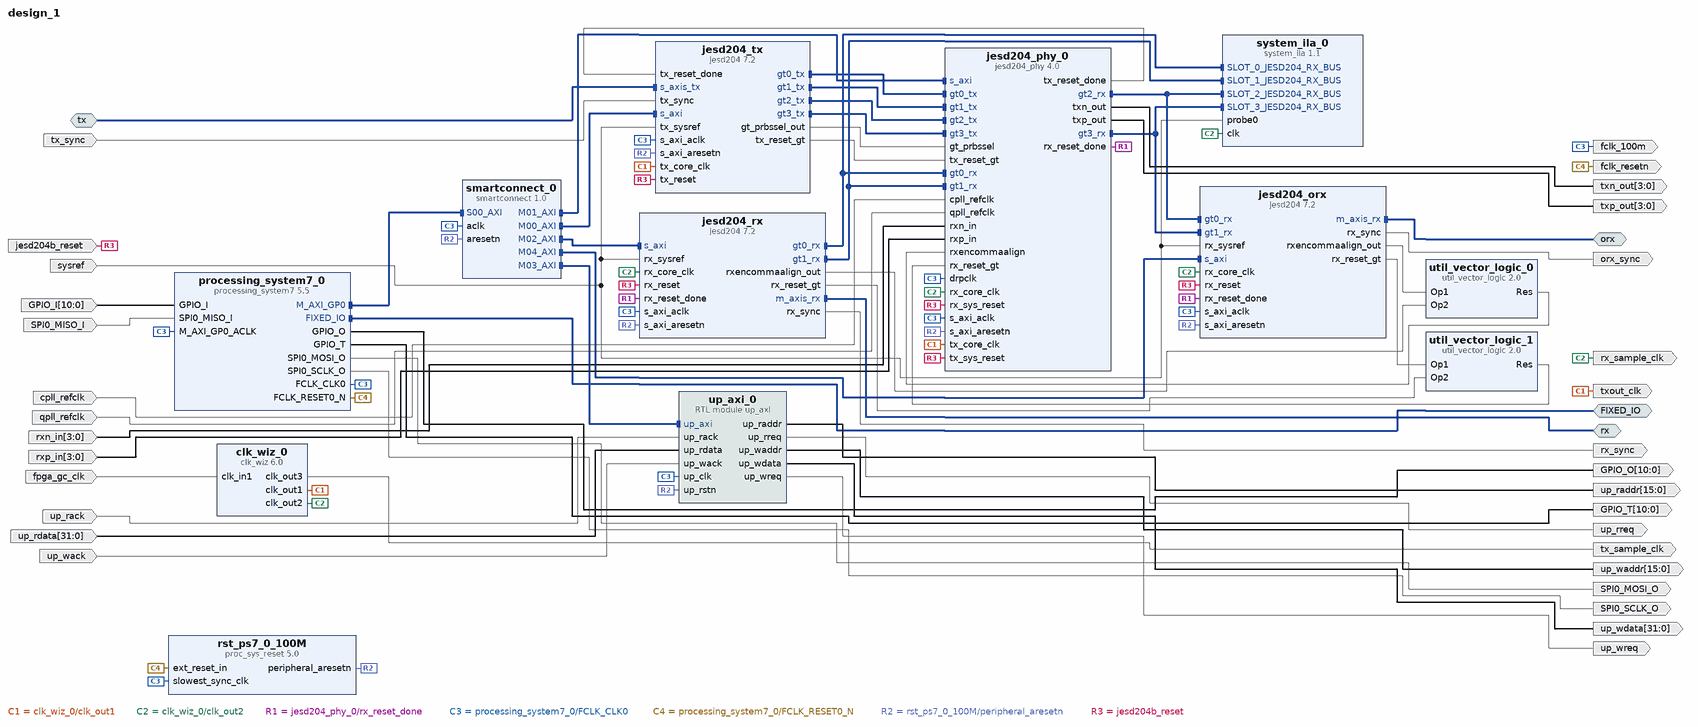
[diagram p0: block diagram of the top level]
# Vivado block design design_1, xc7z100ffg900-2, Vivado 2021.1
create_bd_design design_1

create_bd_intf_port -mode Slave -vlnv xilinx.com:interface:axis_rtl:1.0 tx
set_property -dict [list \
  CONFIG.FREQ_HZ 153600000 \
  CONFIG.HAS_TKEEP 0 \
  CONFIG.HAS_TLAST 0 \
  CONFIG.HAS_TREADY 1 \
  CONFIG.HAS_TSTRB 0 \
  CONFIG.LAYERED_METADATA undef \
  CONFIG.TDATA_NUM_BYTES 16 \
  CONFIG.TDEST_WIDTH 0 \
  CONFIG.TID_WIDTH 0 \
  CONFIG.TUSER_WIDTH 0 \
] [get_bd_intf_ports tx]
create_bd_intf_port -mode Master -vlnv xilinx.com:interface:axis_rtl:1.0 rx
set_property -dict {CONFIG.FREQ_HZ 153600000} [get_bd_intf_ports rx]
create_bd_intf_port -mode Master -vlnv xilinx.com:display_processing_system7:fixedio_rtl:1.0 FIXED_IO
create_bd_intf_port -mode Master -vlnv xilinx.com:interface:axis_rtl:1.0 orx
set_property -dict {CONFIG.FREQ_HZ 153600000} [get_bd_intf_ports orx]
create_bd_port -dir I jesd204b_reset
create_bd_port -dir O -from 3 -to 0 txp_out
create_bd_port -dir O -from 3 -to 0 txn_out
create_bd_port -dir I sysref
create_bd_port -dir I -from 3 -to 0 rxp_in
create_bd_port -dir I -from 3 -to 0 rxn_in
create_bd_port -dir I -type clk cpll_refclk
create_bd_port -dir I -type clk qpll_refclk
create_bd_port -dir I -type clk fpga_gc_clk
set_property -dict {CONFIG.FREQ_HZ 122880000} [get_bd_ports fpga_gc_clk]
create_bd_port -dir O -type clk tx_sample_clk
set_property -dict {CONFIG.FREQ_HZ 307200000} [get_bd_ports tx_sample_clk]
create_bd_port -dir O -type rst fclk_resetn
create_bd_port -dir O -from 10 -to 0 GPIO_O
create_bd_port -dir I -from 10 -to 0 GPIO_I
create_bd_port -dir O -from 10 -to 0 GPIO_T
create_bd_port -dir O -type clk txout_clk
set_property -dict {CONFIG.ASSOCIATED_BUSIF tx CONFIG.FREQ_HZ 153600000} [get_bd_ports txout_clk]
create_bd_port -dir O -type clk rx_sample_clk
set_property -dict {CONFIG.ASSOCIATED_BUSIF rx:orx CONFIG.FREQ_HZ 153600000} [get_bd_ports rx_sample_clk]
create_bd_port -dir I up_rack
create_bd_port -dir I -from 31 -to 0 up_rdata
create_bd_port -dir I up_wack
create_bd_port -dir O -from 15 -to 0 up_waddr
create_bd_port -dir O -from 31 -to 0 up_wdata
create_bd_port -dir O -from 15 -to 0 up_raddr
create_bd_port -dir O up_rreq
create_bd_port -dir O up_wreq
create_bd_port -dir O SPI0_SCLK_O
create_bd_port -dir O SPI0_MOSI_O
create_bd_port -dir I SPI0_MISO_I
create_bd_port -dir O -type clk fclk_100m
create_bd_port -dir I tx_sync
create_bd_port -dir O orx_sync
create_bd_port -dir O rx_sync

create_bd_cell -type ip -vlnv xilinx.com:ip:clk_wiz:6.0 clk_wiz_0
set_property -dict [list \
  CONFIG.CLKIN1_JITTER_PS 81.38 \
  CONFIG.CLKOUT1_JITTER 116.791 \
  CONFIG.CLKOUT1_PHASE_ERROR 100.322 \
  CONFIG.CLKOUT1_REQUESTED_OUT_FREQ 153.6 \
  CONFIG.CLKOUT2_JITTER 116.791 \
  CONFIG.CLKOUT2_PHASE_ERROR 100.322 \
  CONFIG.CLKOUT2_REQUESTED_OUT_FREQ 153.6 \
  CONFIG.CLKOUT2_USED true \
  CONFIG.CLKOUT3_JITTER 102.480 \
  CONFIG.CLKOUT3_PHASE_ERROR 100.322 \
  CONFIG.CLKOUT3_REQUESTED_OUT_FREQ 307.2 \
  CONFIG.CLKOUT3_USED true \
  CONFIG.CLKOUT4_JITTER 116.791 \
  CONFIG.CLKOUT4_PHASE_ERROR 100.322 \
  CONFIG.CLKOUT4_REQUESTED_OUT_FREQ 100.000 \
  CONFIG.CLKOUT4_USED false \
  CONFIG.MMCM_CLKFBOUT_MULT_F 7.500 \
  CONFIG.MMCM_CLKIN1_PERIOD 8.138 \
  CONFIG.MMCM_CLKIN2_PERIOD 10.000 \
  CONFIG.MMCM_CLKOUT0_DIVIDE_F 6.000 \
  CONFIG.MMCM_CLKOUT1_DIVIDE 6 \
  CONFIG.MMCM_CLKOUT2_DIVIDE 3 \
  CONFIG.MMCM_CLKOUT3_DIVIDE 1 \
  CONFIG.MMCM_DIVCLK_DIVIDE 1 \
  CONFIG.NUM_OUT_CLKS 3 \
  CONFIG.PRIM_IN_FREQ 122.88 \
  CONFIG.USE_LOCKED false \
  CONFIG.USE_RESET false \
] [get_bd_cells clk_wiz_0]
create_bd_cell -type ip -vlnv xilinx.com:ip:jesd204:7.2 jesd204_tx
set_property -dict {CONFIG.C_DEFAULT_SCR 1 CONFIG.C_LANES 4 CONFIG.C_SYSREF_SAMPLING_EDGE 0} [get_bd_cells jesd204_tx]
create_bd_cell -type ip -vlnv xilinx.com:ip:jesd204:7.2 jesd204_orx
set_property -dict {CONFIG.C_DEFAULT_SCR 1 CONFIG.C_NODE_IS_TRANSMIT 0} [get_bd_cells jesd204_orx]
create_bd_cell -type ip -vlnv xilinx.com:ip:jesd204:7.2 jesd204_rx
set_property -dict [list \
  CONFIG.C_DEFAULT_F 4 \
  CONFIG.C_DEFAULT_SCR 1 \
  CONFIG.C_LANES 2 \
  CONFIG.C_NODE_IS_TRANSMIT 0 \
] [get_bd_cells jesd204_rx]
create_bd_cell -type ip -vlnv xilinx.com:ip:jesd204_phy:4.0 jesd204_phy_0
set_property -dict [list \
  CONFIG.C_LANES 4 \
  CONFIG.C_PLL_SELECTION 3 \
  CONFIG.Config_Type 1 \
  CONFIG.GT_Line_Rate 6.144 \
  CONFIG.GT_REFCLK_FREQ 122.880 \
  CONFIG.Max_Line_Rate 6.144 \
  CONFIG.Min_Line_Rate 6.144 \
  CONFIG.RX_GT_Line_Rate 6.144 \
  CONFIG.RX_GT_REFCLK_FREQ 122.880 \
  CONFIG.RX_PLL_SELECTION 0 \
  CONFIG.SupportLevel 1 \
] [get_bd_cells jesd204_phy_0]
create_bd_cell -type ip -vlnv xilinx.com:ip:processing_system7:5.5 processing_system7_0
set_property -dict [list \
  CONFIG.PCW_APU_PERIPHERAL_FREQMHZ 666.666666 \
  CONFIG.PCW_CPU_CPU_6X4X_MAX_RANGE 800 \
  CONFIG.PCW_DUAL_PARALLEL_QSPI_DATA_MODE x8 \
  CONFIG.PCW_ENET0_ENET0_IO {MIO 16 .. 27} \
  CONFIG.PCW_ENET0_GRP_MDIO_ENABLE 1 \
  CONFIG.PCW_ENET0_GRP_MDIO_IO {MIO 52 .. 53} \
  CONFIG.PCW_ENET0_PERIPHERAL_ENABLE 1 \
  CONFIG.PCW_ENET0_RESET_ENABLE 0 \
  CONFIG.PCW_ENET_RESET_ENABLE 1 \
  CONFIG.PCW_ENET_RESET_SELECT {Share reset pin} \
  CONFIG.PCW_FPGA0_PERIPHERAL_FREQMHZ 100 \
  CONFIG.PCW_FPGA1_PERIPHERAL_FREQMHZ 50 \
  CONFIG.PCW_GPIO_EMIO_GPIO_ENABLE 1 \
  CONFIG.PCW_GPIO_EMIO_GPIO_IO 11 \
  CONFIG.PCW_GPIO_EMIO_GPIO_WIDTH 11 \
  CONFIG.PCW_GPIO_MIO_GPIO_ENABLE 1 \
  CONFIG.PCW_GPIO_MIO_GPIO_IO MIO \
  CONFIG.PCW_I2C_RESET_ENABLE 0 \
  CONFIG.PCW_PERIPHERAL_BOARD_PRESET None \
  CONFIG.PCW_PRESET_BANK1_VOLTAGE {LVCMOS 1.8V} \
  CONFIG.PCW_QSPI_GRP_IO1_ENABLE 1 \
  CONFIG.PCW_QSPI_GRP_IO1_IO {MIO 0 9 .. 13} \
  CONFIG.PCW_QSPI_GRP_SINGLE_SS_ENABLE 0 \
  CONFIG.PCW_QSPI_INTERNAL_HIGHADDRESS 0xFDFFFFFF \
  CONFIG.PCW_QSPI_PERIPHERAL_ENABLE 1 \
  CONFIG.PCW_QSPI_QSPI_IO {MIO 1 .. 6} \
  CONFIG.PCW_SD0_GRP_CD_ENABLE 0 \
  CONFIG.PCW_SD0_GRP_WP_ENABLE 0 \
  CONFIG.PCW_SD0_PERIPHERAL_ENABLE 1 \
  CONFIG.PCW_SD0_SD0_IO {MIO 40 .. 45} \
  CONFIG.PCW_SDIO_PERIPHERAL_FREQMHZ 100 \
  CONFIG.PCW_SPI0_PERIPHERAL_ENABLE 1 \
  CONFIG.PCW_SPI0_SPI0_IO EMIO \
  CONFIG.PCW_SPI_PERIPHERAL_FREQMHZ 122 \
  CONFIG.PCW_UART0_PERIPHERAL_ENABLE 1 \
  CONFIG.PCW_UART0_UART0_IO {MIO 14 .. 15} \
  CONFIG.PCW_UART1_PERIPHERAL_ENABLE 0 \
  CONFIG.PCW_UART_PERIPHERAL_FREQMHZ 100 \
  CONFIG.PCW_UIPARAM_DDR_FREQ_MHZ 533.3333 \
  CONFIG.PCW_UIPARAM_DDR_MEMORY_TYPE {DDR 3 (Low Voltage)} \
  CONFIG.PCW_UIPARAM_DDR_PARTNO {MT41K256M16 RE-125} \
  CONFIG.PCW_USB0_PERIPHERAL_ENABLE 1 \
  CONFIG.PCW_USB0_RESET_ENABLE 1 \
  CONFIG.PCW_USB0_RESET_IO {MIO 46} \
  CONFIG.PCW_USB0_USB0_IO {MIO 28 .. 39} \
  CONFIG.PCW_USB_RESET_ENABLE 1 \
  CONFIG.PCW_USB_RESET_SELECT {Share reset pin} \
] [get_bd_cells processing_system7_0]
# 500 more settings of processing_system7_0 are not shown: defaults, MIO pin electricals, DDR timing, and values the tool derives
create_bd_cell -type ip -vlnv xilinx.com:ip:proc_sys_reset:5.0 rst_ps7_0_100M
create_bd_cell -type ip -vlnv xilinx.com:ip:smartconnect:1.0 smartconnect_0
set_property -dict {CONFIG.NUM_MI 5 CONFIG.NUM_SI 1} [get_bd_cells smartconnect_0]
create_bd_cell -type ip -vlnv xilinx.com:ip:system_ila:1.1 system_ila_0
set_property -dict [list \
  CONFIG.C_DATA_DEPTH 32768 \
  CONFIG.C_MON_TYPE MIX \
  CONFIG.C_NUM_MONITOR_SLOTS 4 \
  CONFIG.C_NUM_OF_PROBES 2 \
  CONFIG.C_SLOT 0 \
  CONFIG.C_SLOT_0_INTF_TYPE xilinx.com:display_jesd204:jesd204_rx_bus_rtl:1.0 \
  CONFIG.C_SLOT_1_INTF_TYPE xilinx.com:display_jesd204:jesd204_rx_bus_rtl:1.0 \
  CONFIG.C_SLOT_2_INTF_TYPE xilinx.com:display_jesd204:jesd204_rx_bus_rtl:1.0 \
  CONFIG.C_SLOT_3_INTF_TYPE xilinx.com:display_jesd204:jesd204_rx_bus_rtl:1.0 \
] [get_bd_cells system_ila_0]
create_bd_cell -type module -reference up_axi up_axi_0
create_bd_cell -type ip -vlnv xilinx.com:ip:util_vector_logic:2.0 util_vector_logic_0
set_property -dict {CONFIG.C_SIZE 1} [get_bd_cells util_vector_logic_0]
create_bd_cell -type ip -vlnv xilinx.com:ip:util_vector_logic:2.0 util_vector_logic_1
set_property -dict {CONFIG.C_SIZE 1} [get_bd_cells util_vector_logic_1]

# ---- connections ----

connect_bd_intf_net -intf_net jesd204_0_gt0_tx [get_bd_intf_pins jesd204_tx/gt0_tx] [get_bd_intf_pins jesd204_phy_0/gt0_tx]
connect_bd_intf_net -intf_net jesd204_0_gt1_tx [get_bd_intf_pins jesd204_tx/gt1_tx] [get_bd_intf_pins jesd204_phy_0/gt1_tx]
connect_bd_intf_net -intf_net jesd204_0_gt2_tx [get_bd_intf_pins jesd204_tx/gt2_tx] [get_bd_intf_pins jesd204_phy_0/gt2_tx]
connect_bd_intf_net -intf_net jesd204_0_gt3_tx [get_bd_intf_pins jesd204_tx/gt3_tx] [get_bd_intf_pins jesd204_phy_0/gt3_tx]
connect_bd_intf_net -intf_net jesd204_1_m_axis_rx [get_bd_intf_ports rx] [get_bd_intf_pins jesd204_rx/m_axis_rx]
connect_bd_intf_net [get_bd_intf_ports orx] [get_bd_intf_pins jesd204_orx/m_axis_rx]
connect_bd_intf_net [get_bd_intf_pins jesd204_rx/gt0_rx] [get_bd_intf_pins jesd204_phy_0/gt0_rx]
connect_bd_intf_net [get_bd_intf_pins jesd204_rx/gt0_rx] [get_bd_intf_pins system_ila_0/SLOT_0_JESD204_RX_BUS]
connect_bd_intf_net [get_bd_intf_pins jesd204_rx/gt1_rx] [get_bd_intf_pins jesd204_phy_0/gt1_rx]
connect_bd_intf_net [get_bd_intf_pins jesd204_rx/gt1_rx] [get_bd_intf_pins system_ila_0/SLOT_1_JESD204_RX_BUS]
connect_bd_intf_net [get_bd_intf_pins jesd204_phy_0/gt2_rx] [get_bd_intf_pins jesd204_orx/gt0_rx]
connect_bd_intf_net [get_bd_intf_pins jesd204_phy_0/gt2_rx] [get_bd_intf_pins system_ila_0/SLOT_2_JESD204_RX_BUS]
connect_bd_intf_net [get_bd_intf_pins jesd204_phy_0/gt3_rx] [get_bd_intf_pins jesd204_orx/gt1_rx]
connect_bd_intf_net [get_bd_intf_pins jesd204_phy_0/gt3_rx] [get_bd_intf_pins system_ila_0/SLOT_3_JESD204_RX_BUS]
connect_bd_intf_net [get_bd_intf_ports FIXED_IO] [get_bd_intf_pins processing_system7_0/FIXED_IO]
connect_bd_intf_net [get_bd_intf_pins smartconnect_0/S00_AXI] [get_bd_intf_pins processing_system7_0/M_AXI_GP0]
connect_bd_intf_net -intf_net s_axis_tx_0_1 [get_bd_intf_ports tx] [get_bd_intf_pins jesd204_tx/s_axis_tx]
connect_bd_intf_net [get_bd_intf_pins smartconnect_0/M00_AXI] [get_bd_intf_pins jesd204_tx/s_axi]
connect_bd_intf_net [get_bd_intf_pins smartconnect_0/M01_AXI] [get_bd_intf_pins jesd204_phy_0/s_axi]
connect_bd_intf_net [get_bd_intf_pins smartconnect_0/M02_AXI] [get_bd_intf_pins jesd204_rx/s_axi]
connect_bd_intf_net [get_bd_intf_pins up_axi_0/up_axi] [get_bd_intf_pins smartconnect_0/M03_AXI]
connect_bd_intf_net [get_bd_intf_pins smartconnect_0/M04_AXI] [get_bd_intf_pins jesd204_orx/s_axi]
connect_bd_net -net GPIO_I_0_1 [get_bd_ports GPIO_I] [get_bd_pins processing_system7_0/GPIO_I]
connect_bd_net -net SPI0_MISO_I_0_1 [get_bd_ports SPI0_MISO_I] [get_bd_pins processing_system7_0/SPI0_MISO_I]
connect_bd_net -net clk_in1_0_1 [get_bd_ports fpga_gc_clk] [get_bd_pins clk_wiz_0/clk_in1]
connect_bd_net [get_bd_pins clk_wiz_0/clk_out1] [get_bd_ports txout_clk] [get_bd_pins jesd204_tx/tx_core_clk] [get_bd_pins jesd204_phy_0/tx_core_clk]
connect_bd_net [get_bd_pins clk_wiz_0/clk_out2] \
  [get_bd_ports rx_sample_clk] [get_bd_pins jesd204_orx/rx_core_clk] [get_bd_pins jesd204_rx/rx_core_clk] \
  [get_bd_pins jesd204_phy_0/rx_core_clk] [get_bd_pins system_ila_0/clk]
connect_bd_net [get_bd_pins clk_wiz_0/clk_out3] [get_bd_ports tx_sample_clk]
connect_bd_net -net cpll_refclk_0_1 [get_bd_ports cpll_refclk] [get_bd_pins jesd204_phy_0/cpll_refclk]
connect_bd_net -net jesd204_0_gt_prbssel_out [get_bd_pins jesd204_tx/gt_prbssel_out] [get_bd_pins jesd204_phy_0/gt_prbssel]
connect_bd_net -net jesd204_0_tx_reset_gt [get_bd_pins jesd204_tx/tx_reset_gt] [get_bd_pins jesd204_phy_0/tx_reset_gt]
connect_bd_net [get_bd_pins jesd204_orx/rx_reset_gt] [get_bd_pins util_vector_logic_1/Op1]
connect_bd_net [get_bd_pins jesd204_orx/rx_sync] [get_bd_ports orx_sync]
connect_bd_net [get_bd_pins jesd204_orx/rxencommaalign_out] [get_bd_pins util_vector_logic_0/Op1]
connect_bd_net [get_bd_pins jesd204_phy_0/rx_reset_done] [get_bd_pins jesd204_orx/rx_reset_done] [get_bd_pins jesd204_rx/rx_reset_done]
connect_bd_net [get_bd_pins jesd204_phy_0/tx_reset_done] [get_bd_pins jesd204_tx/tx_reset_done]
connect_bd_net [get_bd_pins jesd204_phy_0/txn_out] [get_bd_ports txn_out]
connect_bd_net [get_bd_pins jesd204_phy_0/txp_out] [get_bd_ports txp_out]
connect_bd_net [get_bd_pins jesd204_rx/rx_reset_gt] [get_bd_pins util_vector_logic_1/Op2]
connect_bd_net [get_bd_pins jesd204_rx/rx_sync] [get_bd_ports rx_sync]
connect_bd_net [get_bd_pins jesd204_rx/rxencommaalign_out] [get_bd_pins util_vector_logic_0/Op2]
connect_bd_net [get_bd_pins processing_system7_0/FCLK_CLK0] \
  [get_bd_ports fclk_100m] [get_bd_pins jesd204_tx/s_axi_aclk] [get_bd_pins jesd204_orx/s_axi_aclk] \
  [get_bd_pins jesd204_rx/s_axi_aclk] [get_bd_pins jesd204_phy_0/drpclk] [get_bd_pins jesd204_phy_0/s_axi_aclk] \
  [get_bd_pins processing_system7_0/M_AXI_GP0_ACLK] [get_bd_pins rst_ps7_0_100M/slowest_sync_clk] \
  [get_bd_pins smartconnect_0/aclk] [get_bd_pins up_axi_0/up_clk]
connect_bd_net [get_bd_pins processing_system7_0/FCLK_RESET0_N] [get_bd_ports fclk_resetn] [get_bd_pins rst_ps7_0_100M/ext_reset_in]
connect_bd_net [get_bd_pins processing_system7_0/GPIO_O] [get_bd_ports GPIO_O]
connect_bd_net [get_bd_pins processing_system7_0/GPIO_T] [get_bd_ports GPIO_T]
connect_bd_net [get_bd_pins processing_system7_0/SPI0_MOSI_O] [get_bd_ports SPI0_MOSI_O]
connect_bd_net [get_bd_pins processing_system7_0/SPI0_SCLK_O] [get_bd_ports SPI0_SCLK_O]
connect_bd_net -net qpll_refclk_0_1 [get_bd_ports qpll_refclk] [get_bd_pins jesd204_phy_0/qpll_refclk]
connect_bd_net [get_bd_pins rst_ps7_0_100M/peripheral_aresetn] \
  [get_bd_pins jesd204_tx/s_axi_aresetn] [get_bd_pins jesd204_orx/s_axi_aresetn] [get_bd_pins jesd204_rx/s_axi_aresetn] \
  [get_bd_pins jesd204_phy_0/s_axi_aresetn] [get_bd_pins smartconnect_0/aresetn] [get_bd_pins up_axi_0/up_rstn]
connect_bd_net -net rx_sysref_0_1 [get_bd_ports sysref] \
  [get_bd_pins jesd204_tx/tx_sysref] [get_bd_pins jesd204_orx/rx_sysref] [get_bd_pins jesd204_rx/rx_sysref] \
  [get_bd_pins system_ila_0/probe0]
connect_bd_net -net rxn_in_0_1 [get_bd_ports rxn_in] [get_bd_pins jesd204_phy_0/rxn_in]
connect_bd_net -net rxp_in_0_1 [get_bd_ports rxp_in] [get_bd_pins jesd204_phy_0/rxp_in]
connect_bd_net -net tx_reset_0_1 [get_bd_ports jesd204b_reset] \
  [get_bd_pins jesd204_tx/tx_reset] [get_bd_pins jesd204_orx/rx_reset] [get_bd_pins jesd204_rx/rx_reset] \
  [get_bd_pins jesd204_phy_0/tx_sys_reset] [get_bd_pins jesd204_phy_0/rx_sys_reset]
connect_bd_net -net tx_sync_0_1 [get_bd_ports tx_sync] [get_bd_pins jesd204_tx/tx_sync]
connect_bd_net [get_bd_pins up_axi_0/up_raddr] [get_bd_ports up_raddr]
connect_bd_net [get_bd_pins up_axi_0/up_rreq] [get_bd_ports up_rreq]
connect_bd_net [get_bd_pins up_axi_0/up_waddr] [get_bd_ports up_waddr]
connect_bd_net [get_bd_pins up_axi_0/up_wdata] [get_bd_ports up_wdata]
connect_bd_net [get_bd_pins up_axi_0/up_wreq] [get_bd_ports up_wreq]
connect_bd_net -net up_rack_0_1 [get_bd_ports up_rack] [get_bd_pins up_axi_0/up_rack]
connect_bd_net -net up_rdata_0_1 [get_bd_ports up_rdata] [get_bd_pins up_axi_0/up_rdata]
connect_bd_net -net up_wack_0_1 [get_bd_ports up_wack] [get_bd_pins up_axi_0/up_wack]
connect_bd_net [get_bd_pins util_vector_logic_0/Res] [get_bd_pins jesd204_phy_0/rxencommaalign]
connect_bd_net [get_bd_pins util_vector_logic_1/Res] [get_bd_pins jesd204_phy_0/rx_reset_gt]

# ---- address map ----
assign_bd_address -offset 0x43C00000 -range 64K -target_address_space [get_bd_addr_spaces processing_system7_0/Data] [get_bd_addr_segs jesd204_tx/s_axi/Reg]
assign_bd_address -offset 0x43C10000 -range 64K -target_address_space [get_bd_addr_spaces processing_system7_0/Data] [get_bd_addr_segs jesd204_rx/s_axi/Reg]
assign_bd_address -offset 0x43C20000 -range 64K -target_address_space [get_bd_addr_spaces processing_system7_0/Data] [get_bd_addr_segs jesd204_phy_0/s_axi/Reg]
assign_bd_address -offset 0x43C30000 -range 64K -target_address_space [get_bd_addr_spaces processing_system7_0/Data] [get_bd_addr_segs up_axi_0/up_axi/reg0]
assign_bd_address -offset 0x43C40000 -range 64K -target_address_space [get_bd_addr_spaces processing_system7_0/Data] [get_bd_addr_segs jesd204_orx/s_axi/Reg]

validate_bd_design
save_bd_design
